# Altium schematic sheet Extended_design_unvalidated.SchDoc (part 1 of 3)
size A1; SheetNumber: 3; SheetTotal: 3
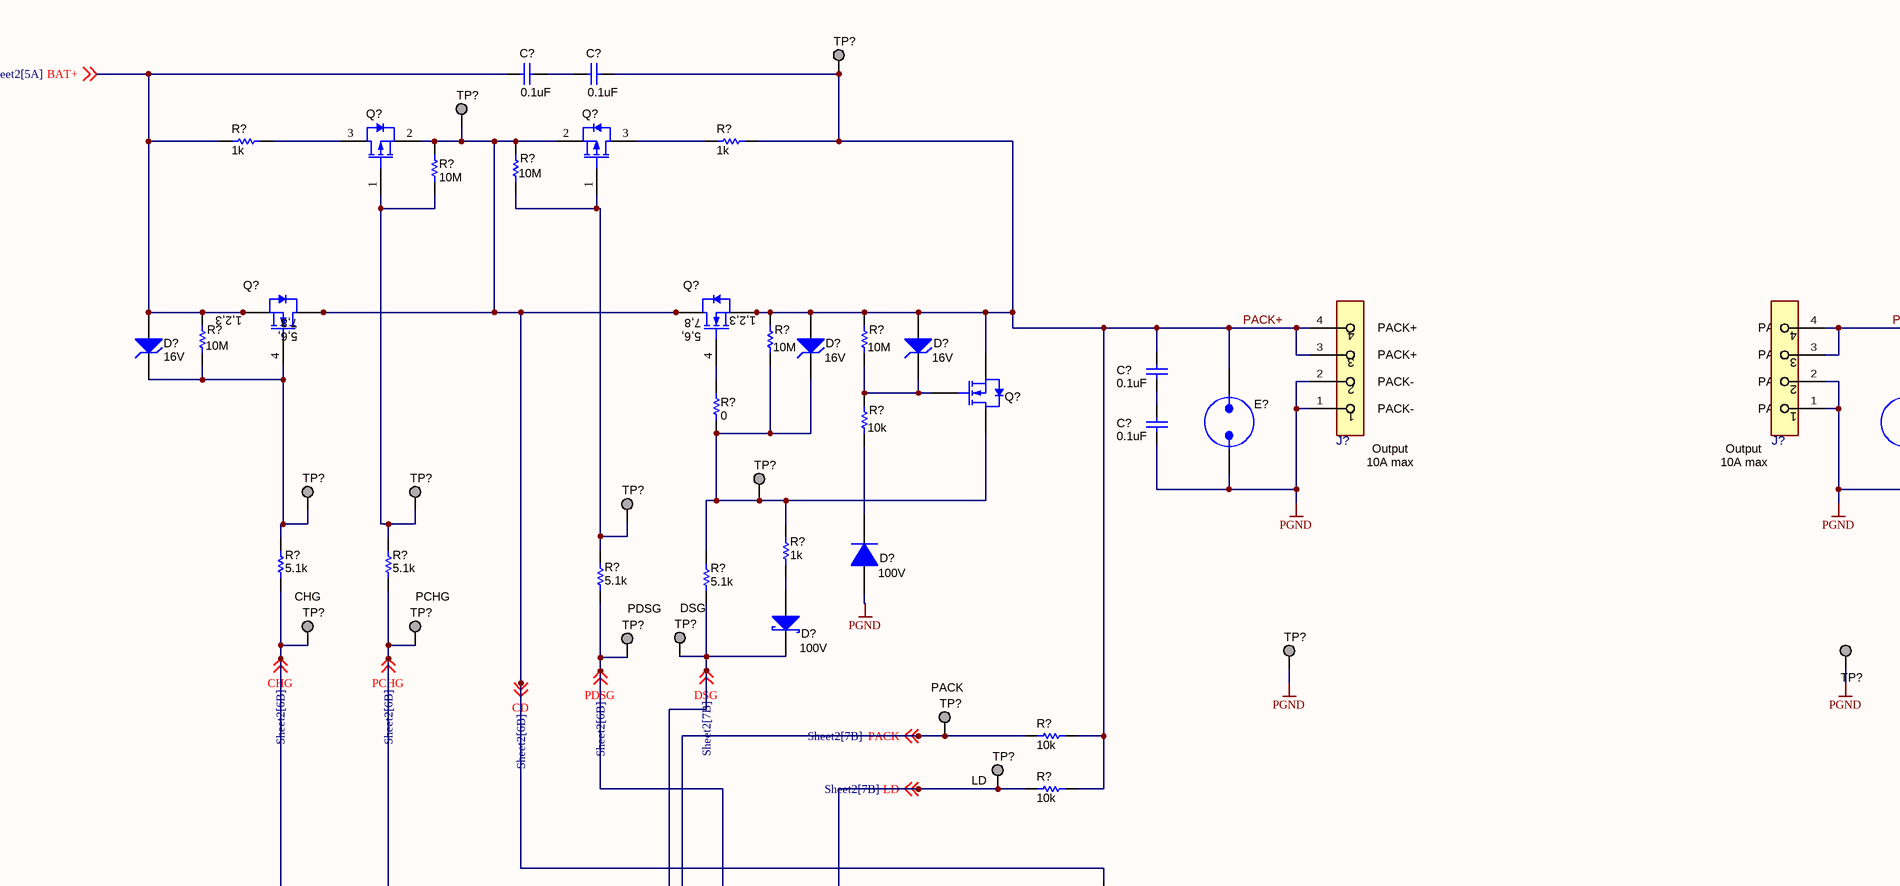
[diagram p0: Extended_design_unvalidated.SchDoc, top left]
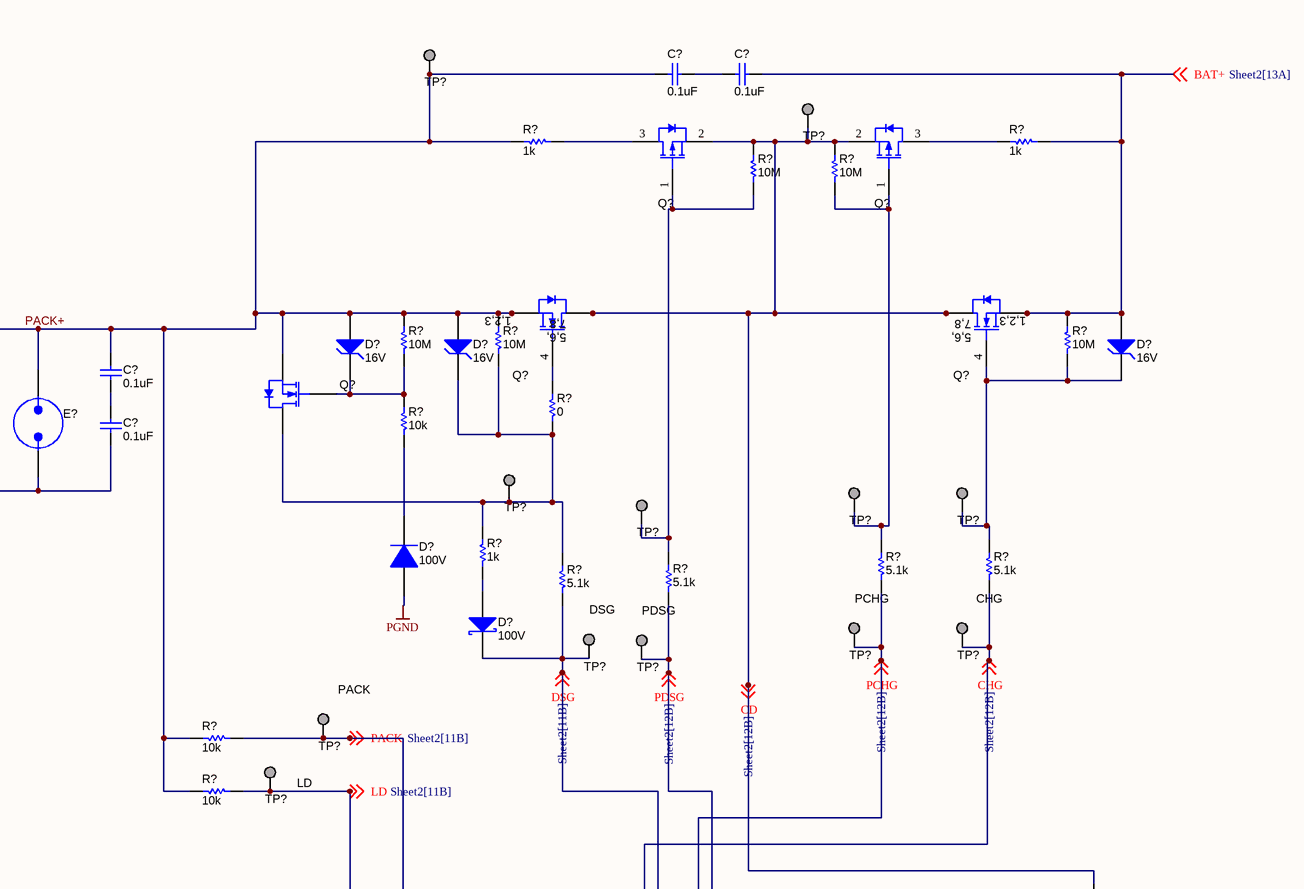
[diagram p1: Extended_design_unvalidated.SchDoc, top right]
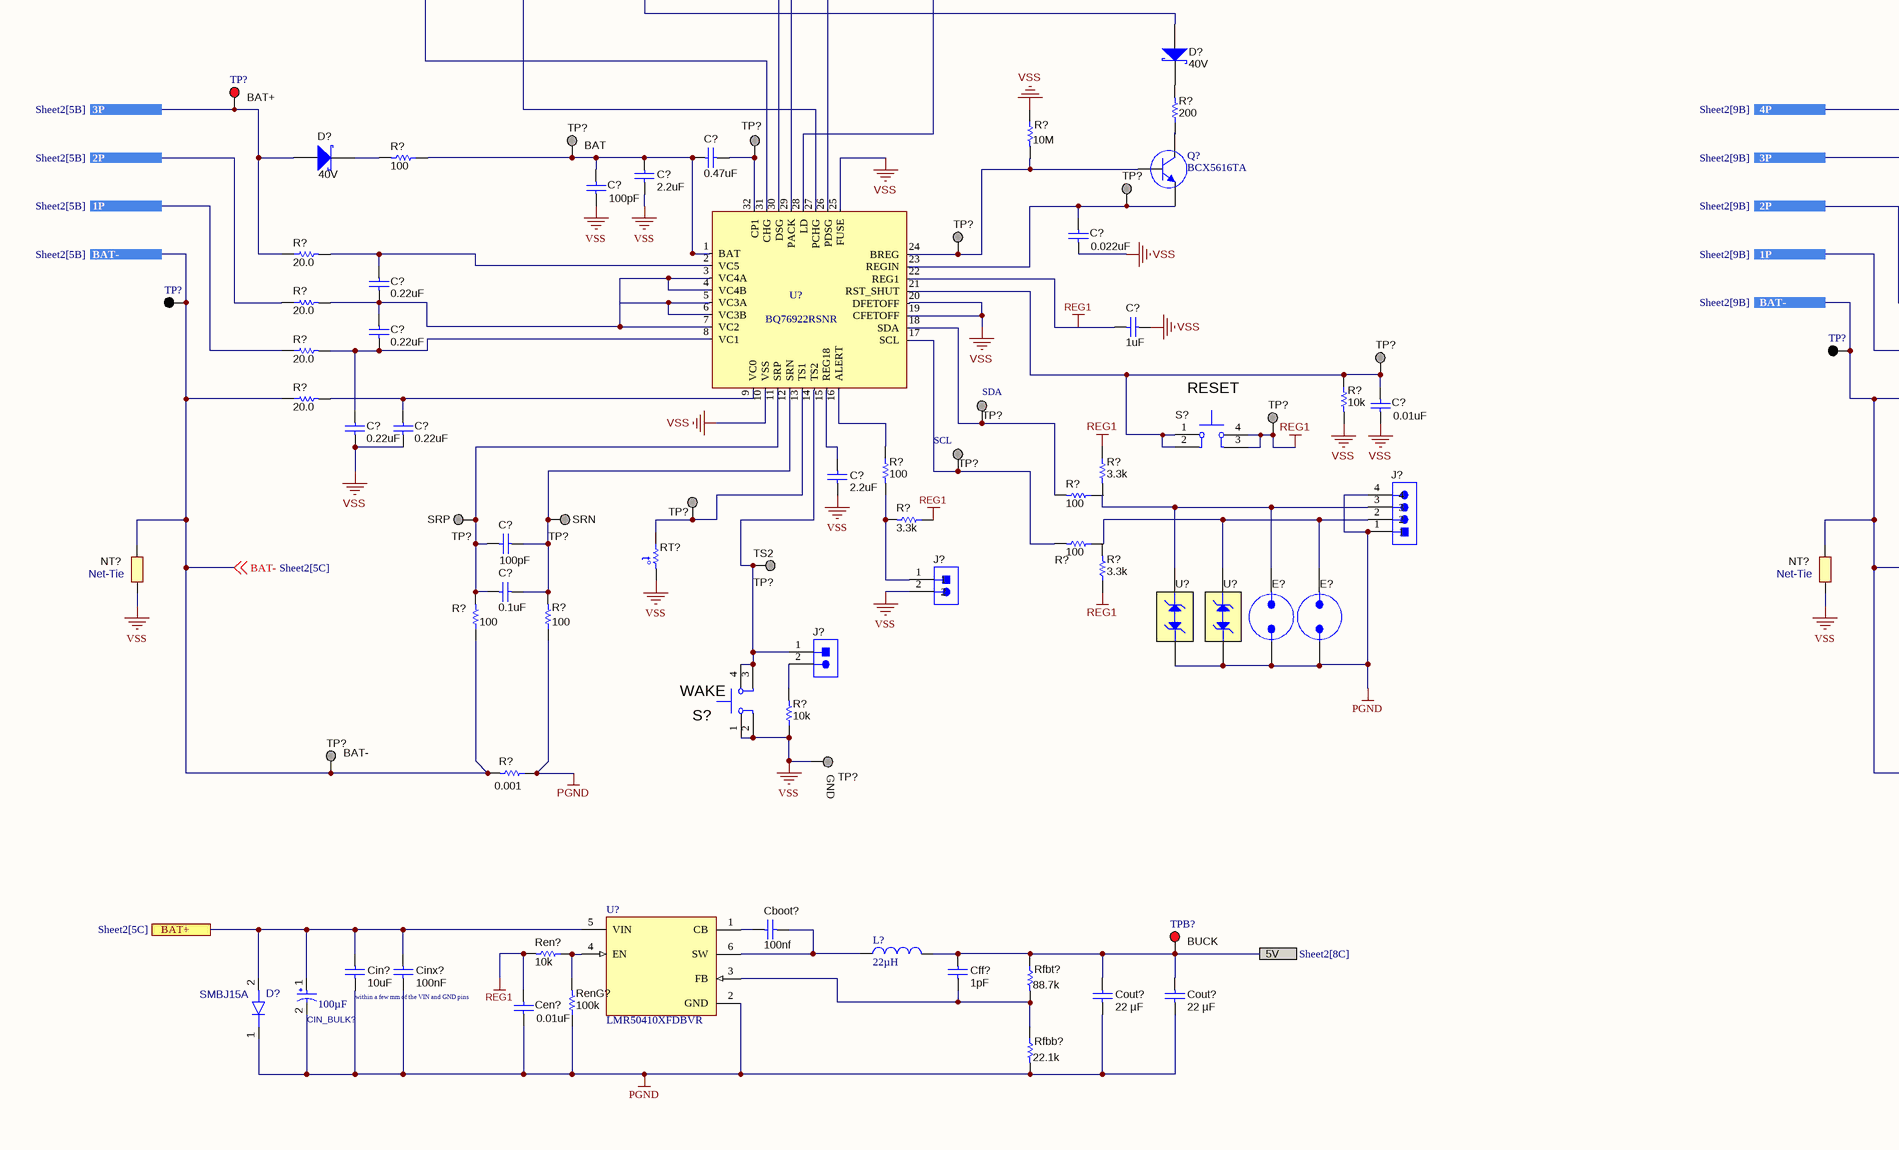
[diagram p2: Extended_design_unvalidated.SchDoc, bottom left]
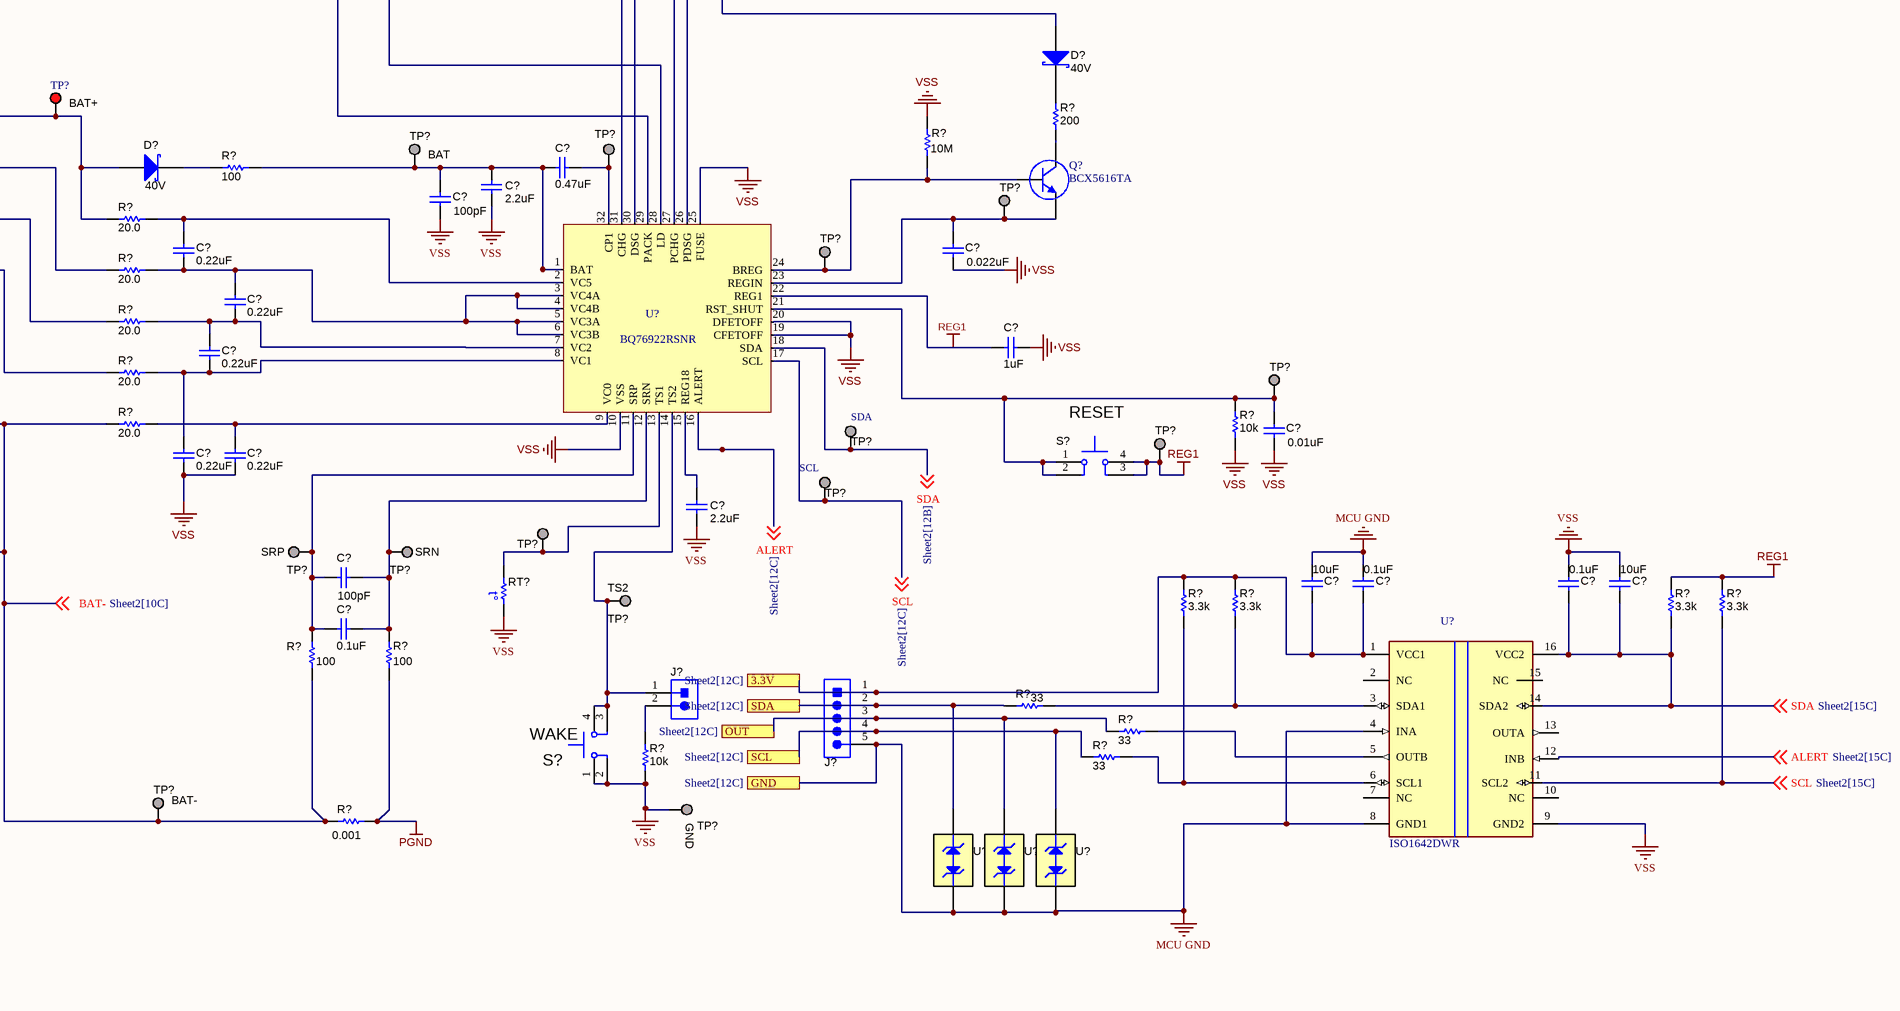
[diagram p3: Extended_design_unvalidated.SchDoc, bottom right]

## Parts
(Parts that share a designator on the sheet are numbered #1, #2 ... from top to bottom, then left to right.)
C?#1  ValueDisplayed: 0.1uF  [0603]  (hidden comment: GCJ188R72A104KA01D)
C?#2  ValueDisplayed: 0.1uF  [0603]  (hidden comment: GCJ188R72A104KA01D)
C?#3  ValueDisplayed: 0.1uF  [0603]  (hidden comment: GCJ188R72A104KA01D)
C?#4  ValueDisplayed: 0.1uF  [0603]  (hidden comment: GCJ188R72A104KA01D)
C?#5  Cap_F: 0.1uF  [0603]  (hidden comment: GCJ188R72A104KA01D)
C?#6  Cap_F: 0.1uF  [0603]  (hidden comment: GCJ188R72A104KA01D)
C?#7  Cap_F: 0.1uF  [0603]  (hidden comment: GCJ188R72A104KA01D)
C?#8  Cap_F: 0.1uF  [0603]  (hidden comment: GCJ188R72A104KA01D)
C?#9  ValueDisplayed: 0.47uF  [0805_HV]  (hidden comment: GCM219R71E474KA55D)
C?#10  ValueDisplayed: 0.47uF  [0805_HV]  (hidden comment: GCM219R71E474KA55D)
C?#11  ValueDisplayed: 2.2uF  [0805_HV]  (hidden comment: EMK212B7225KG-T)
C?#12  ValueDisplayed: 2.2uF  [0805_HV]  (hidden comment: EMK212B7225KG-T)
C?#13  ValueDisplayed: 100pF  [0603]  (hidden comment: C0603C101J5GACTU)
C?#14  ValueDisplayed: 100pF  [0603]  (hidden comment: C0603C101J5GACTU)
C?#15  ValueDisplayed: 0.22uF  [0603]  (hidden comment: C1608X7R1H224K080AB)
C?#16  ValueDisplayed: 0.022uF  [0603]  (hidden comment: 885012206040)
C?#17  ValueDisplayed: 0.022uF  [0603]  (hidden comment: 885012206040)
C?#18  ValueDisplayed: 0.22uF  [0603]  (hidden comment: C1608X7R1H224K080AB)
C?#19  ValueDisplayed: 0.22uF  [0603]  (hidden comment: C1608X7R1H224K080AB)
C?#20  ValueDisplayed: 0.22uF  [0603]  (hidden comment: C1608X7R1H224K080AB)
C?#21  ValueDisplayed: 1uF  [0805_HV]  (hidden comment: EMK212B7105KG-T)
C?#22  ValueDisplayed: 0.22uF  [0603]  (hidden comment: C1608X7R1H224K080AB)
C?#23  ValueDisplayed: 1uF  [0805_HV]  (hidden comment: EMK212B7105KG-T)
C?#24  ValueDisplayed: 0.01uF  [0603]  (hidden comment: 885012206040)
C?#25  ValueDisplayed: 0.01uF  [0603]  (hidden comment: 885012206040)
C?#26  ValueDisplayed: 0.22uF  [0603]  (hidden comment: C1608X7R1H224K080AB)
C?#27  ValueDisplayed: 0.22uF  [0603]  (hidden comment: C1608X7R1H224K080AB)
C?#28  ValueDisplayed: 0.22uF  [0603]  (hidden comment: C1608X7R1H224K080AB)
C?#29  ValueDisplayed: 0.22uF  [0603]  (hidden comment: C1608X7R1H224K080AB)
C?#30  ValueDisplayed: 2.2uF  [0805_HV]  (hidden comment: EMK212B7225KG-T)
C?#31  ValueDisplayed: 2.2uF  [0805_HV]  (hidden comment: EMK212B7225KG-T)
C?#32  ValueDisplayed: 100pF  [0603]  (hidden comment: C0603C101J5GACTU)
C?#33  ValueDisplayed: 100pF  [0603]  (hidden comment: C0603C101J5GACTU)
C?#34  ValueDisplayed: 10uF  [0603]  (hidden comment: 885012206040)
C?#35  ValueDisplayed: 0.1uF  [0603]  (hidden comment: 885012206040)
C?#36  ValueDisplayed: 0.1uF  [0603]  (hidden comment: 885012206040)
C?#37  ValueDisplayed: 10uF  [0603]  (hidden comment: 885012206040)
C?#38  ValueDisplayed: 0.1uF  [0603]  (hidden comment: 885012206095)
C?#39  ValueDisplayed: 0.1uF  [0603]  (hidden comment: 885012206095)
Cboot?  ValueDisplayed: 100nf  [0603]  (hidden comment: 885012206095)
Cen?  ValueDisplayed: 0.01uF  [0603]  (hidden comment: 885012206040)
Cff?  ValueDisplayed: 1pF  [0805_HV]  (hidden comment: EMK212B7225KG-T)
Cin?  ValueDisplayed: 10uF  [0805_HV]  (hidden comment: EMK212B7225KG-T)
CIN_BULK?  value 100µF  [CAPPR65-350-1150X800X1250]  (hidden comment: ECA1HM101)
Cinx?  ValueDisplayed: 100nF  [0805_HV]  (hidden comment: EMK212B7225KG-T)
Cout?#1  ValueDisplayed: 22 µF  [0805_HV]  (hidden comment: EMK212B7225KG-T)
Cout?#2  ValueDisplayed: 22 µF  [0805_HV]  (hidden comment: EMK212B7225KG-T)
D?#1  value 16V  [SOD-123]  (hidden comment: MMSZ5246B-7-F)
D?#2  value 16V  [SOD-123]  (hidden comment: MMSZ5246B-7-F)
D?#3  value 16V  [SOD-123]  (hidden comment: MMSZ5246B-7-F)
D?#4  value 16V  [SOD-123]  (hidden comment: MMSZ5246B-7-F)
D?#5  value 16V  [SOD-123]  (hidden comment: MMSZ5246B-7-F)
D?#6  value 16V  [SOD-123]  (hidden comment: MMSZ5246B-7-F)
D?#7  value 100V  [SOD-123]  (hidden comment: 1N4148W-7-F)
D?#8  value 100V  [SOD-123]  (hidden comment: 1N4148W-7-F)
D?#9  Vr_V: 100V  [SOD-123]  (hidden comment: BAT46W-7-F)
D?#10  Vr_V: 100V  [SOD-123]  (hidden comment: BAT46W-7-F)
D?#11  value 40V  [SOD-123]  (hidden comment: BAS40W-7-F)
D?#12  value 40V  [SOD-123]  (hidden comment: BAS40W-7-F)
D?#13  value 40V  [SOD-123]  (hidden comment: BAS40W-7-F)
D?#14  value 40V  [SOD-123]  (hidden comment: BAS40W-7-F)
D?#15  SMBJ15A
E?#1  Spark Gap  [SPARK_GAP2]  (value not drawn)  (no BOM)
E?#2  Spark Gap  [SPARK_GAP2]  (value not drawn)  (no BOM)
E?#3  Spark Gap  [SPARK_GAP2]  (value not drawn)  (no BOM)
E?#4  Spark Gap  [SPARK_GAP2]  (value not drawn)  (no BOM)
J?#1  OSTTE040161  [FP-OSTTE040161_HDR4-MFG]  (value not drawn)
J?#2  OSTTE040161  [FP-OSTTE040161_HDR4-MFG]  (value not drawn)
J?#3  22/05/3041  [CONN_22-05-3041]  (value not drawn)
J?#4  PEC02SAAN  [CONN_PEC02SAAN]  (value not drawn)
J?#5  PEC02SAAN  [CONN_PEC02SAAN]  (value not drawn)
J?#6  PEC02SAAN  [CONN_PEC02SAAN]  (value not drawn)
J?#7  PEC05SAAN  [Sullins_PxC05SAAN]  (value not drawn)
L?  value 22µH  (hidden comment: VLP8040T-220M)
NT?#1  Net-Tie  [Net-Tie_10milWide_30milLong]  (net tie, no BOM)
NT?#2  Net-Tie  [Net-Tie_10milWide_30milLong]  (net tie, no BOM)
Q?#1  ZXMP10A13FTA  [SOT-23]  (value not drawn)
Q?#2  ZXMP10A13FTA  [SOT-23]  (value not drawn)
Q?#3  ZXMP10A13FTA  [SOT-23]  (value not drawn)
Q?#4  ZXMP10A13FTA  [SOT-23]  (value not drawn)
Q?#5  CSD19532Q5B  [DNK0008A]  (value not drawn)
Q?#6  CSD19532Q5B  [DNK0008A]  (value not drawn)
Q?#7  CSD19532Q5B  [DNK0008A]  (value not drawn)
Q?#8  CSD19532Q5B  [DNK0008A]  (value not drawn)
Q?#9  MOSFET_N_D3G1S2  [SOT-323]  (value not drawn)
Q?#10  MOSFET_N_D3G1S2  [SOT-323]  (value not drawn)
Q?#11  BCX5616TA
Q?#12  BCX5616TA
R?#1  ValueDisplayed: 1k  [2512]  (hidden comment: CRCW25121K00JNEG)
R?#2  ValueDisplayed: 1k  [2512]  (hidden comment: CRCW25121K00JNEG)
R?#3  ValueDisplayed: 1k  [2512]  (hidden comment: CRCW25121K00JNEG)
R?#4  ValueDisplayed: 1k  [2512]  (hidden comment: CRCW25121K00JNEG)
R?#5  ValueDisplayed: 10M  [0603]  (hidden comment: Resistor)
R?#6  ValueDisplayed: 10M  [0603]  (hidden comment: Resistor)
R?#7  ValueDisplayed: 10M  [0603]  (hidden comment: Resistor)
R?#8  ValueDisplayed: 10M  [0603]  (hidden comment: Resistor)
R?#9  ValueDisplayed: 10M  [0603]  (hidden comment: Resistor)
R?#10  ValueDisplayed: 10M  [0603]  (hidden comment: Resistor)
R?#11  ValueDisplayed: 10M  [0603]  (hidden comment: Resistor)
R?#12  ValueDisplayed: 10M  [0603]  (hidden comment: Resistor)
R?#13  ValueDisplayed: 10M  [0603]  (hidden comment: Resistor)
R?#14  ValueDisplayed: 10M  [0603]  (hidden comment: Resistor)
R?#15  ValueDisplayed: 0  [0603]  (hidden comment: CRCW06030000Z0EA)
R?#16  ValueDisplayed: 0  [0603]  (hidden comment: CRCW06030000Z0EA)
R?#17  ValueDisplayed: 10k  [0603]  (hidden comment: Resistor)
R?#18  ValueDisplayed: 10k  [0603]  (hidden comment: Resistor)
R?#19  ValueDisplayed: 1k  [0603]  (hidden comment: CRCW06037K50JNEA)
R?#20  ValueDisplayed: 1k  [0603]  (hidden comment: CRCW06037K50JNEA)
R?#21  ValueDisplayed: 5.1k  [0603]  (hidden comment: CRCW06035K10JNEA)
R?#22  ValueDisplayed: 5.1k  [0603]  (hidden comment: CRCW06035K10JNEA)
R?#23  ValueDisplayed: 5.1k  [0603]  (hidden comment: CRCW06035K10JNEA)
R?#24  ValueDisplayed: 5.1k  [0603]  (hidden comment: CRCW06035K10JNEA)
R?#25  ValueDisplayed: 5.1k  [0603]  (hidden comment: CRCW06035K10JNEA)
R?#26  ValueDisplayed: 5.1k  [1206]  (hidden comment: CRCW12065K10JNEA)
R?#27  ValueDisplayed: 5.1k  [1206]  (hidden comment: CRCW12065K10JNEA)
R?#28  ValueDisplayed: 5.1k  [0603]  (hidden comment: CRCW06035K10JNEA)
R?#29  ValueDisplayed: 10k  [1206]  (hidden comment: CRCW12065K10JNEA)
R?#30  ValueDisplayed: 10k  [1206]  (hidden comment: CRCW12065K10JNEA)
R?#31  ValueDisplayed: 10k  [1206]  (hidden comment: CRCW12065K10JNEA)
R?#32  ValueDisplayed: 10k  [1206]  (hidden comment: CRCW12065K10JNEA)
R?#33  ValueDisplayed: 200  [2512]  (hidden comment: CRCW2512200RJNEG)
R?#34  ValueDisplayed: 200  [2512]  (hidden comment: CRCW2512200RJNEG)
R?#35  ValueDisplayed: 10M  [0603]  (hidden comment: CRCW060310M0JNEA)
R?#36  ValueDisplayed: 10M  [0603]  (hidden comment: CRCW060310M0JNEA)
R?#37  ValueDisplayed: 100  [0603]  (hidden comment: CRCW0603100RJNEA)
R?#38  ValueDisplayed: 100  [0603]  (hidden comment: CRCW0603100RJNEA)
R?#39  ValueDisplayed: 20.0  [1206]  (hidden comment: C1608X7R1H224K080AB)
R?#40  ValueDisplayed: 20.0  [1206]  (hidden comment: C1608X7R1H224K080AB)
R?#41  ValueDisplayed: 20.0  [1206]  (hidden comment: C1608X7R1H224K080AB)
R?#42  ValueDisplayed: 20.0  [1206]  (hidden comment: C1608X7R1H224K080AB)
R?#43  ValueDisplayed: 20.0  [1206]  (hidden comment: C1608X7R1H224K080AB)
R?#44  ValueDisplayed: 20.0  [1206]  (hidden comment: C1608X7R1H224K080AB)
R?#45  ValueDisplayed: 20.0  [1206]  (hidden comment: C1608X7R1H224K080AB)
R?#46  ValueDisplayed: 20.0  [1206]  (hidden comment: C1608X7R1H224K080AB)
R?#47  ValueDisplayed: 10k  [0603]  (hidden comment: CRCW060310K0JNEA)
R?#48  ValueDisplayed: 20.0  [1206]  (hidden comment: C1608X7R1H224K080AB)
R?#49  ValueDisplayed: 10k  [0603]  (hidden comment: CRCW060310K0JNEA)
R?#50  ValueDisplayed: 100  [0603]  (hidden comment: Resistor)
R?#51  ValueDisplayed: 3.3k  [0603]  (hidden comment: CRCW060310K0JNEA)
R?#52  ValueDisplayed: 100  [0603]  (hidden comment: Resistor)
R?#53  ValueDisplayed: 3.3k  [0603]  (hidden comment: CRCW0603100KJNEA)
R?#54  ValueDisplayed: 100  [0603]  (hidden comment: Resistor)
R?#55  ValueDisplayed: 3.3k  [0603]  (hidden comment: CRCW060310K0JNEA)
R?#56  ValueDisplayed: 3.3k  [0603]  (hidden comment: CRCW060310K0JNEA)
R?#57  ValueDisplayed: 3.3k  [0603]  (hidden comment: CRCW060310K0JNEA)
R?#58  ValueDisplayed: 3.3k  [0603]  (hidden comment: CRCW060310K0JNEA)
R?#59  ValueDisplayed: 3.3k  [0603]  (hidden comment: CRCW060310K0JNEA)
R?#60  ValueDisplayed: 100  [0603]  (hidden comment: CRCW0603100RJNEA)
R?#61  ValueDisplayed: 100  [0603]  (hidden comment: CRCW0603100RJNEA)
R?#62  ValueDisplayed: 100  [0603]  (hidden comment: CRCW0603100RJNEA)
R?#63  ValueDisplayed: 100  [0603]  (hidden comment: CRCW0603100RJNEA)
R?#64  ValueDisplayed: 33  [1206]  (hidden comment: CRCW120620R0FKEA)
R?#65  ValueDisplayed: 33  [1206]  (hidden comment: CRCW120620R0FKEA)
R?#66  ValueDisplayed: 10k  [0603]  (hidden comment: CRCW060310K0JNEA)
R?#67  ValueDisplayed: 10k  [0603]  (hidden comment: CRCW060310K0JNEA)
R?#68  ValueDisplayed: 33  [1206]  (hidden comment: CRCW120620R0FKEA)
R?#69  ValueDisplayed: 0.001  [1210M]  (hidden comment: PMR25HZPFV1L00)
R?#70  ValueDisplayed: 0.001  [1210M]  (hidden comment: PMR25HZPFV1L00)
Ren?  ValueDisplayed: 10k  [1206]  (hidden comment: CRCW12065K10JNEA)
RenG?  ValueDisplayed: 100k  [1206]  (hidden comment: CRCW12065K10JNEA)
Rfbb?  ValueDisplayed: 22.1k  [0603]  (hidden comment: Resistor)
Rfbt?  ValueDisplayed: 88.7k  [0603]  (hidden comment: Resistor)
RT?#1  103AT-2  [THERMISTOR_103AT-2]  (value not drawn)
RT?#2  103AT-2  [THERMISTOR_103AT-2]  (value not drawn)
S?#1  SW_KST221JLFS  [SW_KST221JLFS]  (value not drawn)
S?#2  SW_KST221JLFS  [SW_KST221JLFS]  (value not drawn)
S?#3  KST221JLFS  [SW_KST221JLFS]  (value not drawn)
S?#4  KST221JLFS  [SW_KST221JLFS]  (value not drawn)
TP?#1  TESTPOINT  [TP_VIA_060RND040]  (value not drawn)  (no BOM)
TP?#2  TESTPOINT  [TP_VIA_060RND040]  (value not drawn)  (no BOM)
TP?#3  TESTPOINT  [TP_VIA_060RND040]  (value not drawn)  (no BOM)
TP?#4  TESTPOINT  [TP_VIA_060RND040]  (value not drawn)  (no BOM)
TP?#5  TESTPOINT  [TP_VIA_060RND040]  (value not drawn)  (no BOM)
TP?#6  TESTPOINT  [TP_VIA_060RND040]  (value not drawn)  (no BOM)
TP?#7  TESTPOINT  [TP_VIA_060RND040]  (value not drawn)  (no BOM)
TP?#8  TESTPOINT  [TP_VIA_060RND040]  (value not drawn)  (no BOM)
TP?#9  TESTPOINT  [TP_VIA_060RND040]  (value not drawn)  (no BOM)
TP?#10  TESTPOINT  [TP_VIA_060RND040]  (value not drawn)  (no BOM)
TP?#11  TESTPOINT  [TP_VIA_060RND040]  (value not drawn)  (no BOM)
TP?#12  TESTPOINT  [TP_VIA_060RND040]  (value not drawn)  (no BOM)
TP?#13  TESTPOINT  [TP_VIA_060RND040]  (value not drawn)  (no BOM)
TP?#14  TESTPOINT  [TP_VIA_060RND040]  (value not drawn)  (no BOM)
TP?#15  TESTPOINT  [TP_VIA_060RND040]  (value not drawn)  (no BOM)
TP?#16  TESTPOINT  [TP_VIA_060RND040]  (value not drawn)  (no BOM)
TP?#17  TESTPOINT  [TP_VIA_060RND040]  (value not drawn)  (no BOM)
TP?#18  TESTPOINT  [TP_VIA_060RND040]  (value not drawn)  (no BOM)
TP?#19  TESTPOINT  [TP_VIA_060RND040]  (value not drawn)  (no BOM)
TP?#20  TESTPOINT  [TP_VIA_060RND040]  (value not drawn)  (no BOM)
TP?#21  TESTPOINT  [TP_VIA_060RND040]  (value not drawn)  (no BOM)
TP?#22  TESTPOINT  [TP_VIA_060RND040]  (value not drawn)  (no BOM)
TP?#23  TESTPOINT  [TP_VIA_060RND040]  (value not drawn)  (no BOM)
TP?#24  TESTPOINT  [TP_VIA_060RND040]  (value not drawn)  (no BOM)
TP?#25  TESTPOINT  [TP_VIA_060RND040]  (value not drawn)  (no BOM)
TP?#26  TESTPOINT  [TP_VIA_060RND040]  (value not drawn)  (no BOM)
TP?#27  TESTPOINT  [Keystone5010]  (value not drawn)
TP?#28  TESTPOINT  [Keystone5010]  (value not drawn)
TP?#29  TESTPOINT  [TP_VIA_060RND040]  (value not drawn)  (no BOM)
TP?#30  TESTPOINT  [TP_VIA_060RND040]  (value not drawn)  (no BOM)
TP?#31  TESTPOINT  [TP_VIA_060RND040]  (value not drawn)  (no BOM)
TP?#32  TESTPOINT  [TP_VIA_060RND040]  (value not drawn)  (no BOM)
TP?#33  TESTPOINT  [TP_VIA_060RND040]  (value not drawn)  (no BOM)
TP?#34  TESTPOINT  [TP_VIA_060RND040]  (value not drawn)  (no BOM)
TP?#35  TESTPOINT  [TP_VIA_060RND040]  (value not drawn)  (no BOM)
TP?#36  TESTPOINT  [TP_VIA_060RND040]  (value not drawn)  (no BOM)
TP?#37  TESTPOINT  [Keystone5011]  (value not drawn)
TP?#38  TESTPOINT  [Keystone5011]  (value not drawn)
TP?#39  TESTPOINT  [TP_VIA_060RND040]  (value not drawn)  (no BOM)
TP?#40  TESTPOINT  [TP_VIA_060RND040]  (value not drawn)  (no BOM)
TP?#41  TESTPOINT  [TP_VIA_060RND040]  (value not drawn)  (no BOM)
TP?#42  TESTPOINT  [TP_VIA_060RND040]  (value not drawn)  (no BOM)
TP?#43  TESTPOINT  [TP_VIA_060RND040]  (value not drawn)  (no BOM)
TP?#44  TESTPOINT  [TP_VIA_060RND040]  (value not drawn)  (no BOM)
TP?#45  TESTPOINT  [TP_VIA_060RND040]  (value not drawn)  (no BOM)
TP?#46  TESTPOINT  [TP_VIA_060RND040]  (value not drawn)  (no BOM)
TP?#47  TESTPOINT  [TP_VIA_060RND040]  (value not drawn)  (no BOM)
TP?#48  TESTPOINT  [TP_VIA_060RND040]  (value not drawn)  (no BOM)
TP?#49  TESTPOINT  [TP_50MIL-25MILHOLE]  (value not drawn)  (no BOM)
TP?#50  TESTPOINT  [TP_50MIL-25MILHOLE]  (value not drawn)  (no BOM)
TP?#51  TESTPOINT  [TP_50MIL-25MILHOLE]  (value not drawn)  (no BOM)
TP?#52  TESTPOINT  [TP_50MIL-25MILHOLE]  (value not drawn)  (no BOM)
TP?#53  TESTPOINT  [TP_50MIL-25MILHOLE]  (value not drawn)  (no BOM)
TP?#54  TESTPOINT  [TP_50MIL-25MILHOLE]  (value not drawn)  (no BOM)
TP?#55  TESTPOINT  [TP_VIA_060RND040]  (value not drawn)  (no BOM)
TP?#56  TESTPOINT  [TP_VIA_060RND040]  (value not drawn)  (no BOM)
TP?#57  TESTPOINT  [TP_VIA_060RND040]  (value not drawn)  (no BOM)
TP?#58  TESTPOINT  [TP_VIA_060RND040]  (value not drawn)  (no BOM)
TPB?  TESTPOINT  [Keystone5010]  (value not drawn)
U?#1  BQ76922RSNR  [QFN32_RSN_TEX-M]
U?#2  BQ76922RSNR  [QFN32_RSN_TEX-M]
U?#3  TPD1E10B06DPYR  [DPY0002A]  (value not drawn)
U?#4  TPD1E10B06DPYR  [DPY0002A]  (value not drawn)
U?#5  ISO1642DWR  [FP-DW0016B-IPC_C]
U?#6  ESD  [DPY0002A]  (value not drawn)
U?#7  ESD  [DPY0002A]  (value not drawn)
U?#8  ESD  [DPY0002A]  (value not drawn)
U?#9  LMR50410XFDBVR  [FP-DBV0006A-IPC_B]

## Ports
1P (see Sheet2[5B]), 2P (see Sheet2[5B]), 3.3V (see Sheet2[12C]), 3P (see Sheet2[5B]),  1P (see Sheet2[9B]),  2P (see Sheet2[9B]),  3P (see Sheet2[9B]),  4P (see Sheet2[9B]),  5V (see Sheet2[8C]),   BAT+ (see Sheet2[5C]),  BAT- (see Sheet2[9B]), BAT- (see Sheet2[5B]), GND (see Sheet2[12C]), OUT (see Sheet2[12C]), SCL (see Sheet2[12C]), SDA (see Sheet2[12C])

## Nets
MCU GND: C?#34.1 C?#35.1 J?#7.5 U?#5.4(INA) U?#5.8(GND1) U?#6.2(A) U?#7.2(A) U?#8.2(A) ; port GND
PGND: C?#7.1 C?#8.1 Cen?.2 Cin?.1 CIN_BULK?.2 Cinx?.1 Cout?#1.1 Cout?#2.1 D?#7.2(A) D?#8.2(A) D?#15.1(K) E?#1.2 E?#2.2 E?#3.2 E?#4.2 J?#1.1 J?#1.2 J?#2.1 J?#2.2 J?#3.1 J?#3.4 R?#61.1 R?#63.1 R?#69.1 R?#70.1 RenG?.1 Rfbb?.2 TP?#21.1 TP?#22.1 U?#3.2(A) U?#4.2(A) U?#9.2(GND)
REG1: C?#21.2 C?#23.2 Cen?.1 R?#51.1 R?#53.1 R?#55.1 R?#58.1 R?#59.1 Ren?.2 S?#1.3 S?#1.4 S?#2.3 S?#2.4 TP?#43.1 TP?#44.1 U?#1.22(REG1) U?#2.22(REG1)
VSS: C?#11.1 C?#12.1 C?#13.2 C?#14.2 C?#16.2 C?#17.2 C?#21.1 C?#23.1 C?#24.2 C?#25.2 C?#26.1 C?#27.1 C?#28.1 C?#29.1 C?#30.1 C?#31.1 C?#36.1 C?#37.1 J?#4.2 NT?#1.1 NT?#2.1 R?#35.1 R?#36.1 R?#47.2 R?#49.2 R?#66.1 R?#67.1 RT?#1.2 RT?#2.2 S?#3.1 S?#3.2 S?#4.1 S?#4.2 TP?#56.1 TP?#58.1 U?#1.10(VSS) U?#1.19(CFETOFF) U?#1.20(DFETOFF) U?#1.25(FUSE) U?#2.10(VSS) U?#2.19(CFETOFF) U?#2.20(DFETOFF) U?#2.25(FUSE) U?#5.9(GND2)
3.3V: C?#34.2 C?#35.2 J?#7.1 R?#56.1 R?#57.1 U?#5.1(VCC1) ; port 3.3V
 1P: R?#44.1 R?#45.1 ; port 1P, port  1P
 2P: R?#42.1 R?#43.1 ; port 2P, port  2P
 3P: D?#13.2(A) R?#40.1 R?#41.1 TP?#27.1 ; port 3P, port  3P
 4P: D?#14.2(A) R?#39.1 TP?#28.1 ; port  4P
 5V: Cff?.2 Cout?#1.2 Cout?#2.2 L?.2 Rfbt?.1 TPB?.1 ; port  5V
  BAT+: Cin?.2 CIN_BULK?.1 Cinx?.2 D?#15.2(A) U?#9.5(VIN) ; port   BAT+
  BAT-: NT?#1.2 NT?#2.2 R?#46.1 R?#48.1 R?#60.1 R?#62.1 R?#69.2 R?#70.2 TP?#37.1 TP?#38.1 TP?#55.1 TP?#57.1 ; off-sheet BAT-, off-sheet   BAT-, port BAT-, port  BAT-  [also labelled BAT-]
 ALERT: U?#2.16(ALERT) U?#5.12(INB) ; off-sheet ALERT, off-sheet  ALERT  [also labelled ALERT]
 BAT+: C?#1.2 C?#4.2 D?#1.2(A) D?#6.2(A) Q?#5.1(S) Q?#5.2(S) Q?#5.3(S) Q?#8.1(S) Q?#8.2(S) Q?#8.3(S) R?#1.1 R?#4.1 R?#9.1 R?#14.1 ; off-sheet BAT+, off-sheet  BAT+  [also labelled BAT+]
 CD: D?#11.2(A) D?#12.2(A) Q?#1.2(S) Q?#2.2(S) Q?#3.2(S) Q?#4.2(S) Q?#5.5(D) Q?#5.6(D) Q?#5.7(D) Q?#5.8(D) Q?#5.9(D) Q?#6.5(D) Q?#6.6(D) Q?#6.7(D) Q?#6.8(D) Q?#6.9(D) Q?#7.5(D) Q?#7.6(D) Q?#7.7(D) Q?#7.8(D) Q?#7.9(D) Q?#8.5(D) Q?#8.6(D) Q?#8.7(D) Q?#8.8(D) Q?#8.9(D) R?#5.1 R?#6.1 R?#7.1 R?#8.1 TP?#3.1 TP?#4.1 ; off-sheet CD, off-sheet  CD  [also labelled CD]
 CHG: R?#21.1 R?#24.1 TP?#13.1 TP?#16.1 U?#1.31(CHG) U?#2.31(CHG) ; off-sheet CHG, off-sheet  CHG  [also labelled CHG]
 DSG: D?#9.1(K) D?#10.1(K) R?#26.1 R?#27.1 TP?#18.1 TP?#19.1 U?#1.30(DSG) U?#2.30(DSG) ; off-sheet DSG, off-sheet  DSG  [also labelled DSG]
 LD: R?#31.2 R?#32.2 TP?#25.1 TP?#26.1 U?#1.28(LD) U?#2.29(PACK) ; off-sheet LD, off-sheet  LD  [also labelled LD]
 PACK: R?#29.2 R?#30.2 TP?#23.1 TP?#24.1 U?#1.29(PACK) U?#2.28(LD) ; off-sheet PACK, off-sheet  PACK  [also labelled PACK]
 PCHG: R?#22.1 R?#23.1 TP?#14.1 TP?#15.1 U?#1.27(PCHG) U?#2.27(PCHG) ; off-sheet PCHG, off-sheet  PCHG  [also labelled PCHG]
 PDSG: R?#25.1 R?#28.1 TP?#17.1 TP?#20.1 U?#1.26(PDSG) U?#2.26(PDSG) ; off-sheet PDSG, off-sheet  PDSG  [also labelled PDSG]
 SCL: R?#59.2 TP?#46.1 U?#2.17(SCL) U?#5.11(SCL2) ; off-sheet SCL, off-sheet  SCL  [also labelled SCL]
 SDA: C?#36.2 C?#37.2 R?#58.2 TP?#42.1 U?#2.18(SDA) U?#5.14(SDA2) U?#5.16(VCC2) ; off-sheet SDA, off-sheet  SDA  [also labelled SDA]
OUT: J?#7.3 R?#65.1 U?#7.1(K) ; port OUT
PACK+: C?#2.1 C?#3.1 C?#5.2 C?#6.2 D?#2.2(A) D?#3.2(A) D?#4.2(A) D?#5.2(A) E?#1.1 E?#2.1 J?#1.3 J?#1.4 J?#2.3 J?#2.4 Q?#6.1(S) Q?#6.2(S) Q?#6.3(S) Q?#7.1(S) Q?#7.2(S) Q?#7.3(S) Q?#9.2(S) Q?#10.2(S) R?#2.2 R?#3.2 R?#10.1 R?#11.1 R?#12.1 R?#13.1 R?#29.1 R?#30.1 R?#31.1 R?#32.1 TP?#1.1 TP?#2.1
SCL: J?#7.4 R?#68.1 U?#8.1(K) ; port SCL
SDA: J?#7.2 R?#64.1 U?#6.1(K) ; port SDA
NetC?#1_1: C?#1.1 C?#2.2
NetC?#3_2: C?#3.2 C?#4.1
NetC?#5_1: C?#5.1 C?#7.2
NetC?#6_1: C?#6.1 C?#8.2
NetC?#9_1: C?#9.1 C?#11.2 C?#13.1 R?#37.1 TP?#29.1 U?#1.1(BAT)
NetC?#9_2: C?#9.2 TP?#30.1 U?#1.32(CP1)
NetC?#10_1: C?#10.1 C?#12.2 C?#14.1 R?#38.1 TP?#31.1 U?#2.1(BAT)
NetC?#10_2: C?#10.2 TP?#32.1 U?#2.32(CP1)
NetC?#15_1: C?#15.1 C?#19.2 R?#41.2 U?#2.3(VC4A) U?#2.4(VC4B) U?#2.5(VC3A) U?#2.6(VC3B)
NetC?#15_2: C?#15.2 R?#39.2 U?#2.2(VC5)
NetC?#16_1: C?#16.1 Q?#11.1(E) TP?#33.1 U?#1.23(REGIN)
NetC?#17_1: C?#17.1 Q?#12.1(E) TP?#34.1 U?#2.23(REGIN)
NetC?#18_1: C?#18.1 C?#20.2 R?#42.2 U?#1.3(VC4A) U?#1.4(VC4B) U?#1.5(VC3A) U?#1.6(VC3B) U?#1.7(VC2)
NetC?#18_2: C?#18.2 R?#40.2 U?#1.2(VC5)
NetC?#19_1: C?#19.1 C?#22.2 R?#43.2 U?#2.7(VC2)
NetC?#20_1: C?#20.1 C?#26.2 R?#44.2 U?#1.8(VC1)
NetC?#22_1: C?#22.1 C?#28.2 R?#45.2 U?#2.8(VC1)
NetC?#24_1: C?#24.1 R?#47.1 S?#1.1 S?#1.2 TP?#39.1 U?#1.21(RST_SHUT)
NetC?#25_1: C?#25.1 R?#49.1 S?#2.1 S?#2.2 TP?#40.1 U?#2.21(RST_SHUT)
NetC?#27_2: C?#27.2 R?#46.2 U?#1.9(VC0)
NetC?#29_2: C?#29.2 R?#48.2 U?#2.9(VC0)
NetC?#30_2: C?#30.2 U?#1.15(REG18)
NetC?#31_2: C?#31.2 U?#2.15(REG18)
NetC?#32_1: C?#32.1 C?#38.2 R?#61.2 TP?#50.1 U?#1.12(SRN)
NetC?#32_2: C?#32.2 C?#38.1 R?#60.2 TP?#49.1 U?#1.11(SRP)
NetC?#33_1: C?#33.1 C?#39.2 R?#63.2 TP?#52.1 U?#2.12(SRN)
NetC?#33_2: C?#33.2 C?#39.1 R?#62.2 TP?#51.1 U?#2.11(SRP)
NetCboot?_1: Cboot?.1 U?#9.1(CB)
NetCboot?_2: Cboot?.2 L?.1 U?#9.6(SW)
NetCff?_1: Cff?.1 Rfbb?.1 Rfbt?.2 U?#9.3(FB)
NetD?#1_1: D?#1.1(K) Q?#5.4(G) R?#9.2 R?#21.2 TP?#7.1
NetD?#2_1: D?#2.1(K) Q?#9.3(D) R?#10.2 R?#15.2 R?#19.2 R?#26.2 TP?#5.1
NetD?#3_1: D?#3.1(K) Q?#9.1(G) R?#11.2 R?#17.1
NetD?#4_1: D?#4.1(K) Q?#10.1(G) R?#12.2 R?#18.1
NetD?#5_1: D?#5.1(K) Q?#10.3(D) R?#13.2 R?#16.2 R?#20.2 R?#27.2 TP?#6.1
NetD?#6_1: D?#6.1(K) Q?#8.4(G) R?#14.2 R?#24.2 TP?#10.1
NetD?#7_1: D?#7.1(K) R?#17.2
NetD?#8_1: D?#8.1(K) R?#18.2
NetD?#9_2: D?#9.2(A) R?#19.1
NetD?#10_2: D?#10.2(A) R?#20.1
NetD?#11_1: D?#11.1(K) R?#33.2
NetD?#12_1: D?#12.1(K) R?#34.2
NetD?#13_1: D?#13.1(K) R?#37.2
NetD?#14_1: D?#14.1(K) R?#38.2
NetE?#3_1: E?#3.1 J?#3.3 R?#51.2 U?#3.1(K)
NetE?#4_1: E?#4.1 J?#3.2 R?#54.1 U?#4.1(K)
NetJ?#4_1: J?#4.1 R?#50.2 R?#53.2
NetJ?#5_1: J?#5.1 S?#3.3 S?#3.4 TP?#53.1 U?#1.14(TS2)
NetJ?#5_2: J?#5.2 R?#66.2
NetJ?#6_1: J?#6.1 S?#4.3 S?#4.4 TP?#54.1 U?#2.14(TS2)
NetJ?#6_2: J?#6.2 R?#67.2
NetQ?#1_1: Q?#1.1(G) R?#5.2 R?#22.2 TP?#8.1
NetQ?#1_3: Q?#1.3(D) R?#1.2
NetQ?#2_1: Q?#2.1(G) R?#6.2 R?#25.2 TP?#11.1
NetQ?#2_3: Q?#2.3(D) R?#2.1
NetQ?#3_1: Q?#3.1(G) R?#7.2 R?#28.2 TP?#12.1
NetQ?#3_3: Q?#3.3(D) R?#3.1
NetQ?#4_1: Q?#4.1(G) R?#8.2 R?#23.2 TP?#9.1
NetQ?#4_3: Q?#4.3(D) R?#4.2
NetQ?#6_4: Q?#6.4(G) R?#15.1
NetQ?#7_4: Q?#7.4(G) R?#16.1
NetQ?#11_2: Q?#11.2(B) R?#35.2 TP?#35.1 U?#1.24(BREG)
NetQ?#11_3: Q?#11.3(C) R?#33.1
NetQ?#12_2: Q?#12.2(B) R?#36.2 TP?#36.1 U?#2.24(BREG)
NetQ?#12_3: Q?#12.3(C) R?#34.1
NetR?#50_1: R?#50.1 U?#1.16(ALERT)
NetR?#52_2: R?#52.2 TP?#41.1 U?#1.18(SDA)
NetR?#54_2: R?#54.2 TP?#45.1 U?#1.17(SCL)
NetR?#56_2: R?#56.2 R?#68.2 U?#5.6(SCL1)
NetR?#57_2: R?#57.2 R?#64.2 U?#5.3(SDA1)
NetR?#65_2: R?#65.2 U?#5.5(OUTB)
NetRen?_1: Ren?.1 RenG?.2 U?#9.4(EN)
NetRT?#1_1: RT?#1.1 TP?#47.1 U?#1.13(TS1)
NetRT?#2_1: RT?#2.1 TP?#48.1 U?#2.13(TS1)

Not connected (* = marked no-connect by the designer): R?#52 1; R?#55 2; U?#5 2(NC) 7(NC) 10(NC) 13(OUTA) 15(NC)

## Notes on the sheet
- (near J?#1) PACK+
- (near J?#2) PACK+
- (near J?#1) PACK-
- (near J?#2) PACK-
- (near J?#1) Output
- 10A max
- (near J?#2) Output
- CHG
- PCHG
- PDSG
- (near R?#26) DSG
- (near R?#27) DSG
- (near TP?#23) PACK
- (near TP?#24) PACK
- (near TP?#25) LD
- (near TP?#26) LD
- (near TP?#27) BAT+
- (near TP?#28) BAT+
- (near TP?#29) BAT
- (near TP?#31) BAT
- (near TP?#45) SCL
- (near TP?#41) SDA
- RESET
- (near TP?#46) SCL
- (near TP?#42) SDA
- (near TP?#49) SRP
- (near TP?#50) SRN
- (near TP?#53) TS2
- (near TP?#51) SRP
- (near TP?#52) SRN
- (near TP?#54) TS2
- (near S?#3) WAKE
- (near S?#4) WAKE
- (near TP?#55) BAT-
- (near TP?#56) GND
- (near TP?#57) BAT-
- (near TP?#58) GND
- (near TPB?) BUCK
- within a few mm of the VIN and GND pins
- (in symbol CMP-0000958-3) 1,2,3; 7,8; 5,6,
- (in symbol CMP-0002341-2) t°